# Altium schematic sheet IMU_Sheet.SchDoc
size 420 x 297 mm; SheetNumber: 4; SheetTotal: 5
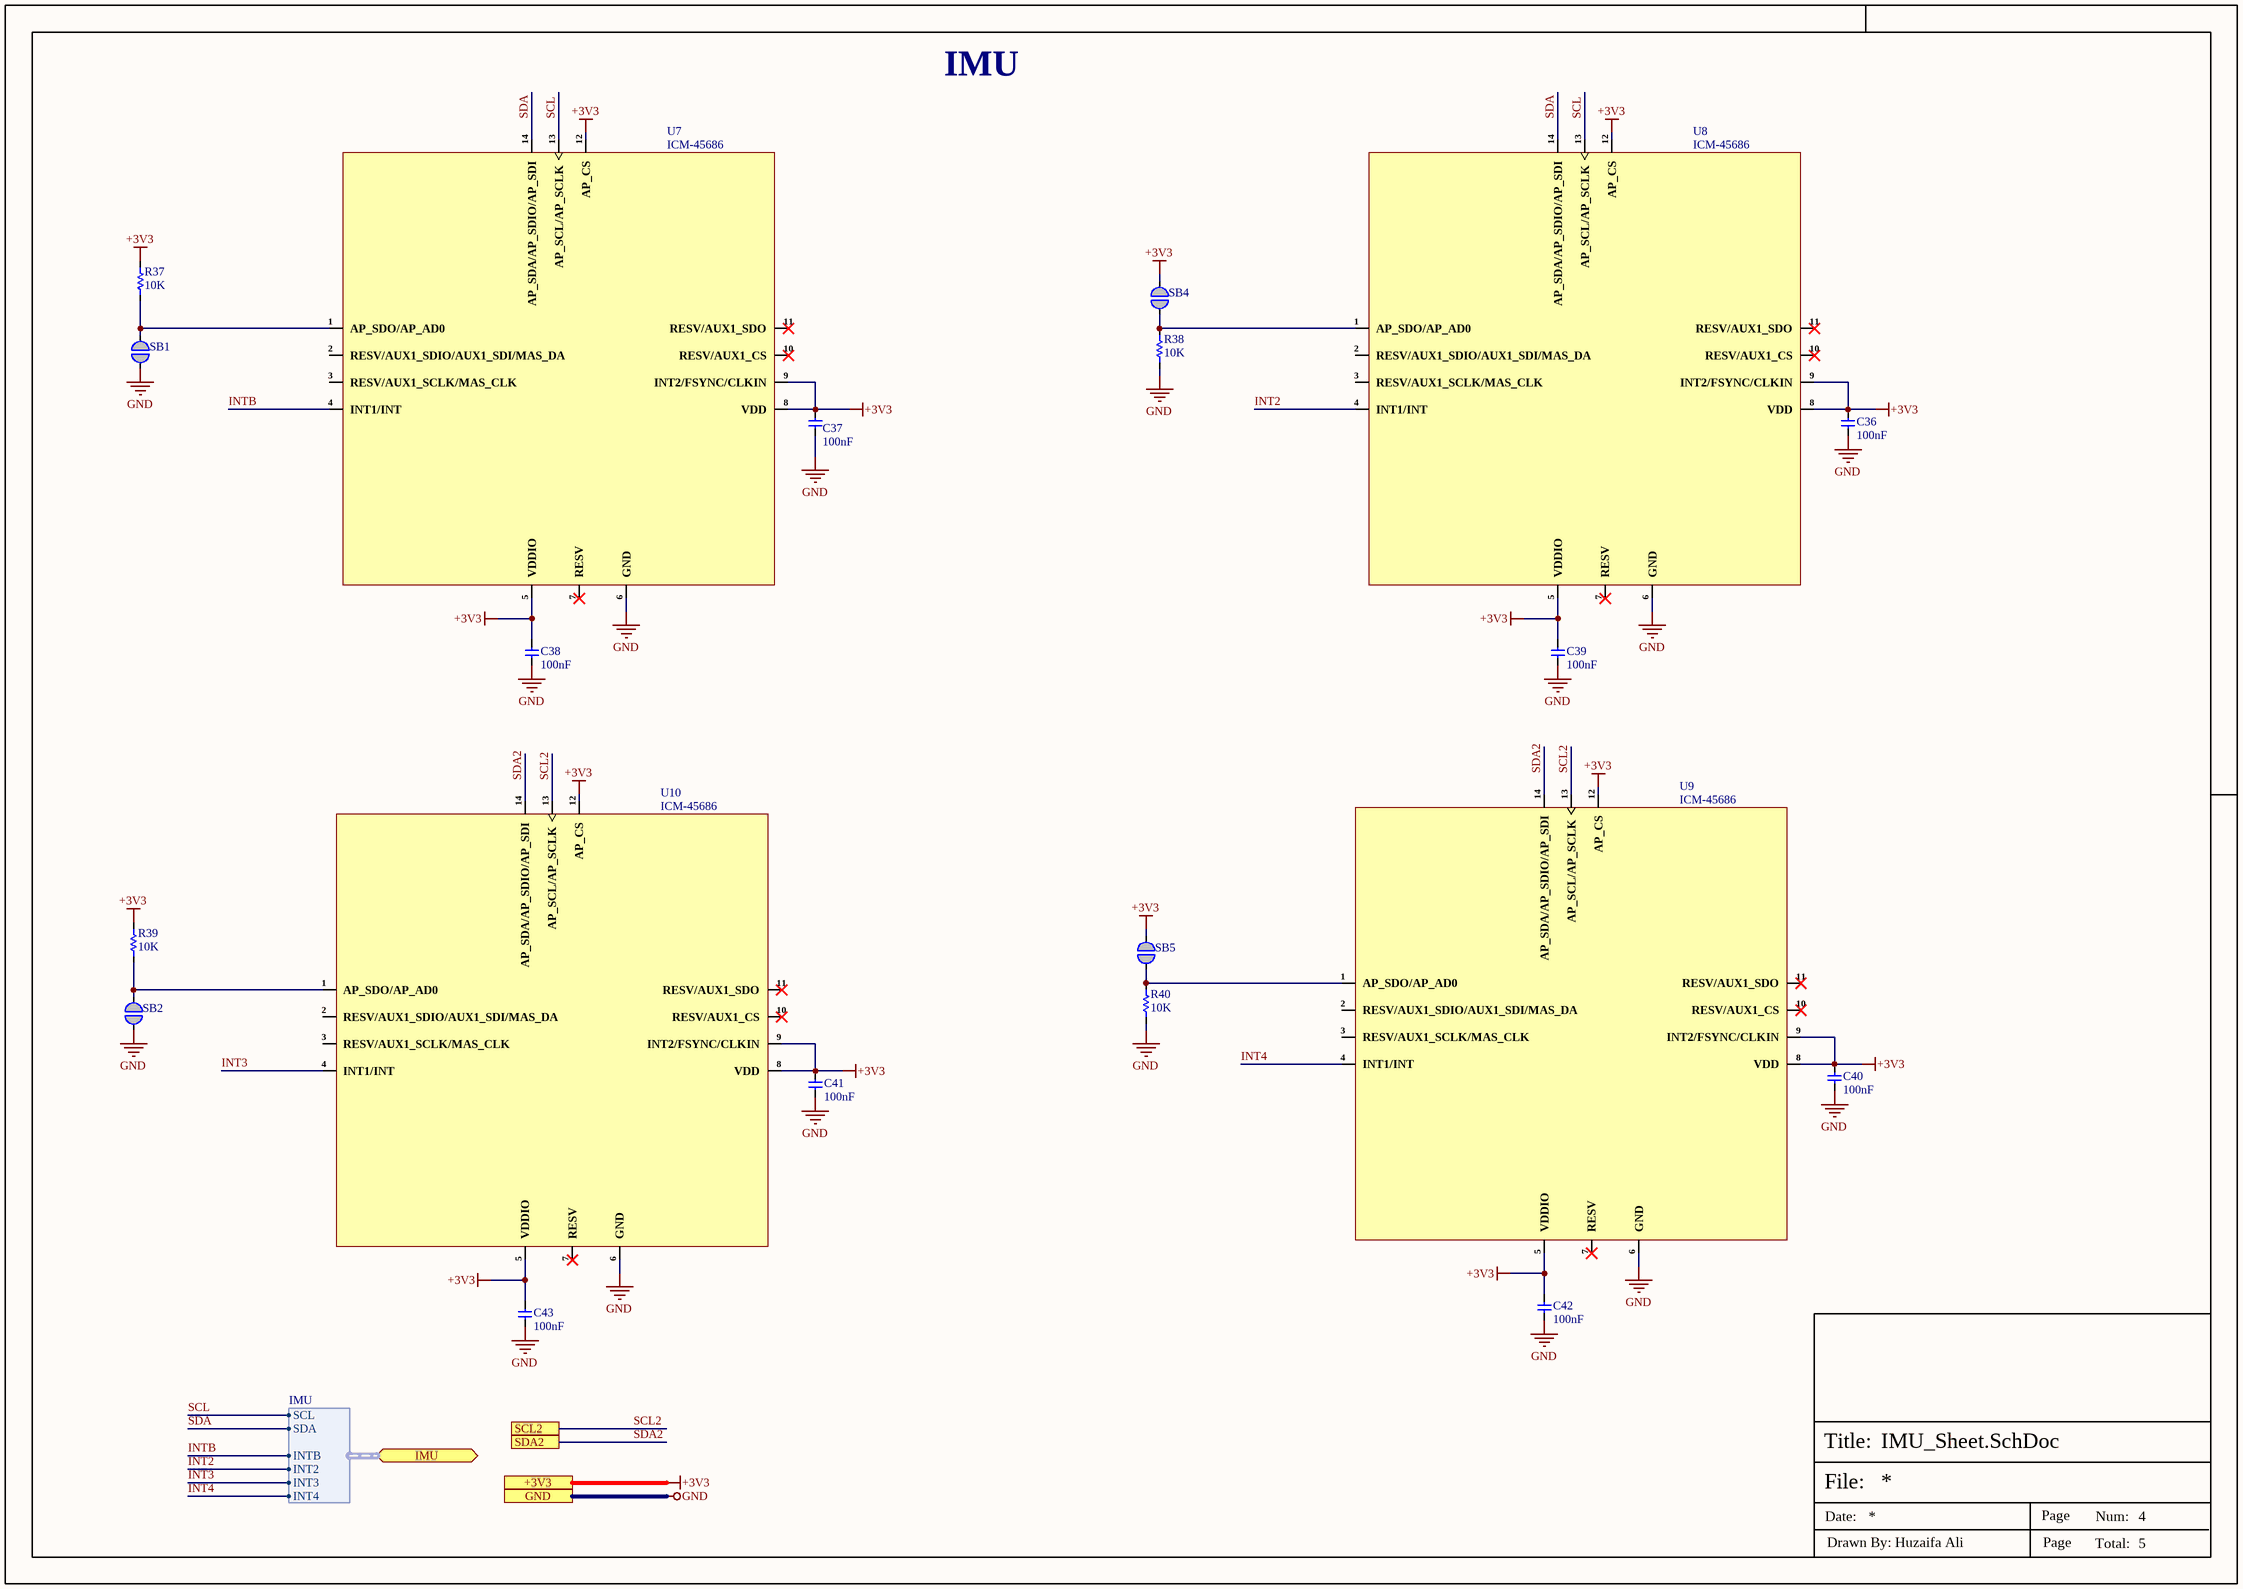
[diagram p0: IMU_Sheet.SchDoc]

## Parts
C36  100nF  [cap-0402]
C37  100nF  [cap-0402]
C38  100nF  [cap-0402]
C39  100nF  [cap-0402]
C40  100nF  [cap-0402]
C41  100nF  [cap-0402]
C42  100nF  [cap-0402]
C43  100nF  [cap-0402]
R37  10K  [Res-0402]
R38  10K  [Res-0402]
R39  10K  [Res-0402]
R40  10K  [Res-0402]
SB1  Solder Bridge 0603  [Solder Bridge]  (value not drawn)  (no BOM)
SB2  Solder Bridge 0603  [Solder Bridge]  (value not drawn)  (no BOM)
SB4  Solder Bridge 0603  [Solder Bridge]  (value not drawn)  (no BOM)
SB5  Solder Bridge 0603  [Solder Bridge]  (value not drawn)  (no BOM)
U7  ICM-45686  [LGA-14(3x2.5)]
U8  ICM-45686  [LGA-14(3x2.5)]
U9  ICM-45686  [LGA-14(3x2.5)]
U10  ICM-45686  [LGA-14(3x2.5)]

## Ports
+3V3, GND, IMU (bidir, harness IMU), SCL2, SDA2

## Harnesses
IMU: SCL, SDA, INTB, INT2, INT3, INT4

## Nets
+3V3: C36.2 C37.2 C38.2 C39.2 C40.2 C41.2 C42.2 C43.2 R37.2 R39.2 SB4.1 SB5.1 U7.5(VDDIO) U7.8(VDD) U7.9(INT2/FSYNC/CLKIN) U7.12(AP_CS) U8.5(VDDIO) U8.8(VDD) U8.9(INT2/FSYNC/CLKIN) U8.12(AP_CS) U9.5(VDDIO) U9.8(VDD) U9.9(INT2/FSYNC/CLKIN) U9.12(AP_CS) U10.5(VDDIO) U10.8(VDD) U10.9(INT2/FSYNC/CLKIN) U10.12(AP_CS) ; port +3V3
GND: C36.1 C37.1 C38.1 C39.1 C40.1 C41.1 C42.1 C43.1 R38.1 R40.1 SB1.2 SB2.2 U7.6(GND) U8.6(GND) U9.6(GND) U10.6(GND) ; port GND
INT2: U8.4(INT1/INT) ; port IMU.INT2
INT3: U10.4(INT1/INT) ; port IMU.INT3
INT4: U9.4(INT1/INT) ; port IMU.INT4
INTB: U7.4(INT1/INT) ; port IMU.INTB
SCL: U7.13(AP_SCL/AP_SCLK) U8.13(AP_SCL/AP_SCLK) ; port IMU.SCL
SCL2: U9.13(AP_SCL/AP_SCLK) U10.13(AP_SCL/AP_SCLK) ; port SCL2
SDA: U7.14(AP_SDA/AP_SDIO/AP_SDI) U8.14(AP_SDA/AP_SDIO/AP_SDI) ; port IMU.SDA
SDA2: U9.14(AP_SDA/AP_SDIO/AP_SDI) U10.14(AP_SDA/AP_SDIO/AP_SDI) ; port SDA2
NetR37_1: R37.1 SB1.1 U7.1(AP_SDO/AP_AD0)
NetR38_2: R38.2 SB4.2 U8.1(AP_SDO/AP_AD0)
NetR39_1: R39.1 SB2.1 U10.1(AP_SDO/AP_AD0)
NetR40_2: R40.2 SB5.2 U9.1(AP_SDO/AP_AD0)

Not connected (* = marked no-connect by the designer): U7 2(RESV/AUX1_SDIO/AUX1_SDI/MAS_DA) 3(RESV/AUX1_SCLK/MAS_CLK) 7(RESV)* 10(RESV/AUX1_CS)* 11(RESV/AUX1_SDO)*; U8 2(RESV/AUX1_SDIO/AUX1_SDI/MAS_DA) 3(RESV/AUX1_SCLK/MAS_CLK) 7(RESV)* 10(RESV/AUX1_CS)* 11(RESV/AUX1_SDO)*; U9 2(RESV/AUX1_SDIO/AUX1_SDI/MAS_DA) 3(RESV/AUX1_SCLK/MAS_CLK) 7(RESV)* 10(RESV/AUX1_CS)* 11(RESV/AUX1_SDO)*; U10 2(RESV/AUX1_SDIO/AUX1_SDI/MAS_DA) 3(RESV/AUX1_SCLK/MAS_CLK) 7(RESV)* 10(RESV/AUX1_CS)* 11(RESV/AUX1_SDO)*

## Notes on the sheet
- IMU
- File:
- Title:
- Date:
- Page
- Num:
- Total:
- Drawn By: Huzaifa Ali

## Library data of the parts
C36-C43 = C1005X7R1H104KT000F: CAP CER 0.1UF 50V X7R 0402; Manufacturer: TDK; Tolerance: 10%; Voltage: 25V; Item Type: Capacitor; Supplier 1: Avnet; Manufacturer Part Number: C1005X7R1H104KT000F; RoHS: No; Category: Ceramic Capacitors; Dielectric: X7R; Supplier Part Number 1: C1005X7R1H104KT000F; LCSC Part Number: C361198; ComponentLink1Description: LCSC; ComponentLink1URL: https://www.lcsc.com/product-detail/Multilayer-Ceramic-Capacitors-MLCC-SMD-SMT_TDK-C1005X7R1H104KT000F_C361198.html
R37-R40 = RE0402DRE0710KL: RES SMD 10K OHM 0.5% 1/16W 0402; Manufacturer: Yageo; Value: 10kR; Max Power Dissipation: 63mW; Temperature Coefficient: 50ppm/°C; Item Type: Resistor; Supplier: Future Electronics; Supplier Part Number: 8132697; Manufacturer Part Number: RE0402DRE0710KL; RoHS: Yes; Category: Chip SMD Resistors; Stock: 10000; Pricing: 10000=0.0059, 40000=0.0056, 150000=0.0053, 250000=0.0052, 500000=0.0049 (USD); Case/Package: 0402; Min Operating Temperature: -55°C; Max Operating Temperature: 155°C; Packaging: Tape and Reel; Number of Terminations: 2; Tolerance: 0.5%; Features: Moisture Resistant; Series: RE; Length: 0.039inch; Width: 0.02inch; Height: 0.015inch; RoHS Compliant: Yes; ComponentLink1URL: http://www.yageo.com/NewPortal/yageodocoutput?fileName=/pdf/R-Chip/PYu-RE_105_RoHS_L_6.pdf&src-supplier=Digi-Key; ComponentLink1Description: http://www.yageo.com/NewPortal/yageodocoutput?fileName=/pdf/R-Chip/PYu-RE_105_RoHS_L_6.pdf&src-supplier=Digi-Key; LCSC Part Number: C851874
SB1 SB2 SB4 SB5 = Solder Bridge 0603: Solder Bridge ON; Manufacturer Part Number: Solder Bridge; Item Type: Solder Bridge
U7-U10 = ICM-45686: 6 AXIS MEMES SENSOR; Manufacturer: TDK InvenSense; Item Type: IC; Supplier: Digikey; LCSC Part Number: C22459454; Manufacturer Part Number: ICM-45686; RoHS: No; Stock: 19377; Pricing: 1=5.86, 5=5.27, 10=5.052, 25=4.7908, 50=4.6122, 100=4.4484, 500=4.11884, 1000=3.99605 (USD)